# Altium project EQ_Guit.PrjPcb
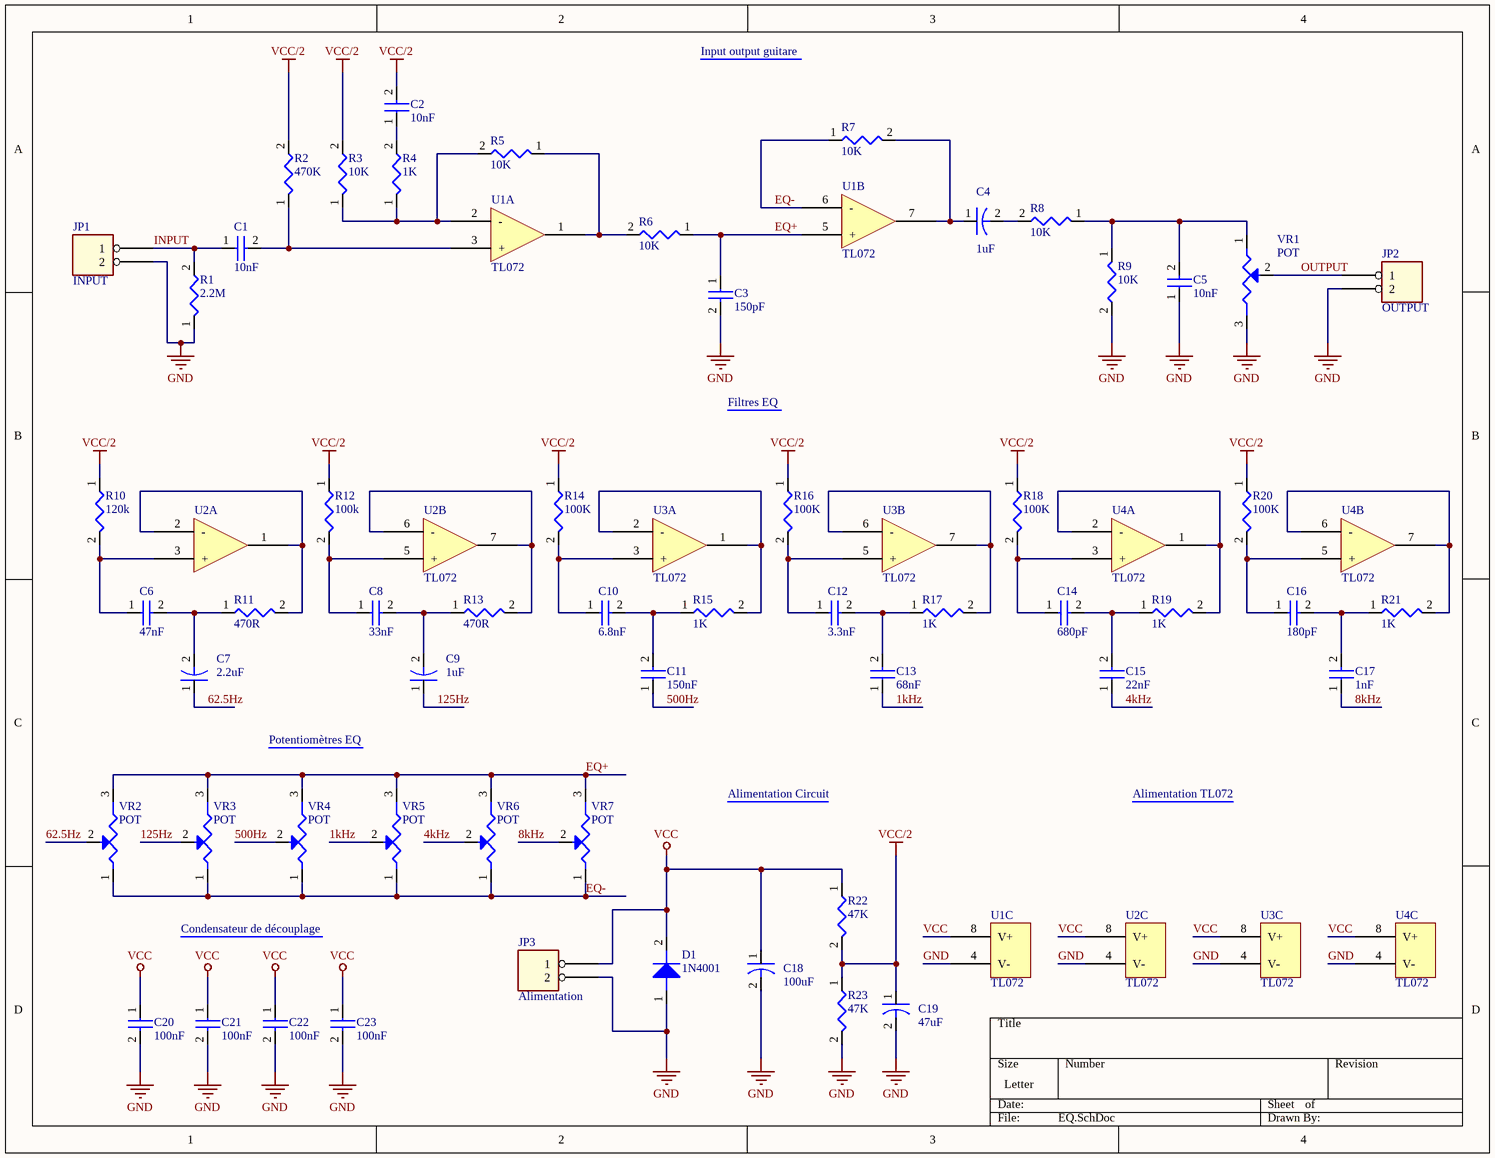
[diagram p0: EQ.SchDoc]
1 sheet, 61 parts. Net scope: global (net labels, ports and power ports of the same name join across sheets).
Board file: EQ.PcbDoc

## Sheet EQ.SchDoc: Pedale EQ
size Letter; DrawnBy: Alexandre DIonne; Revision: V1; SheetNumber: 1; SheetTotal: 1

### Parts
C1  10nF  [CAP_FILM]
C2  10nF  [CAP_FILM]
C3  150pF  [CAP_0603]
C4  1uF  [CAP_TH]
C5  10nF  [CAP_FILM]
C6  47nF  [CAP_FILM]
C7  2.2uF  [CAP_TH]
C8  33nF  [CAP_FILM]
C9  1uF  [CAP_TH]
C10  6.8nF  [CAP_FILM]
C11  150nF  [CAP_FILM]
C12  3.3nF  [CAP_FILM]
C13  68nF  [CAP_FILM]
C14  680pF  [CAP_0603]
C15  22nF  [CAP_FILM]
C16  180pF  [CAP_0603]
C17  1nF  [CAP_0603]
C18  100uF  [CAP_100uF]
C19  47uF  [CAP_TH]
C20  100nF  [CAP_0603]
C21  100nF  [CAP_0603]
C22  100nF  [CAP_0603]
C23  100nF  [CAP_0603]
D1  1N4001  [1N4001]
JP1  INPUT  [Header_2]
JP2  OUTPUT  [Header_2]
JP3  Alimentation  [Header_2]
R1  2.2M  [RES_0805]
R2  470K  [RES_0805]
R3  10K  [RES_0805]
R4  1K  [RES_0805]
R5  10K  [RES_0805]
R6  10K  [RES_0805]
R7  10K  [RES_0805]
R8  10K  [RES_0805]
R9  10K  [RES_0805]
R10  120k  [RES_0805]
R11  470R  [RES_0805]
R12  100k  [RES_0805]
R13  470R  [RES_0805]
R14  100K  [RES_0805]
R15  1K  [RES_0805]
R16  100K  [RES_0805]
R17  1K  [RES_0805]
R18  100K  [RES_0805]
R19  1K  [RES_0805]
R20  100K  [RES_0805]
R21  1K  [RES_0805]
R22  47K  [RES_0805]
R23  47K  [RES_0805]
U1  TL072  [TL072]  (parts A,B,C of 3)
U2  (no value)  [TL072]  (parts A,B,C of 3)
U3  TL072  [TL072]  (parts A,B,C of 3)
U4  TL072  [TL072]  (parts A,B,C of 3)
VR1  POT  [PT01-D120D-B503]
VR2  POT  [PT01-D120D-B503]
VR3  POT  [PT01-D120D-B503]
VR4  POT  [PT01-D120D-B503]
VR5  POT  [PT01-D120D-B503]
VR6  POT  [PT01-D120D-B503]
VR7  POT  [PT01-D120D-B503]

### Nets
GND: C3.2 C5.1 C18.2 C19.2 C20.2 C21.2 C22.2 C23.2 D1.1(ANODE) JP1.2 JP2.2 JP3.2 R1.1 R9.2 R23.2 U1.4(V-) U2.4(V-) U3.4(V-) U4.4(V-) VR1.3(B)
VCC: C18.1 C20.1 C21.1 C22.1 C23.1 D1.2(CATHODE) JP3.1 R22.1 U1.8(V+) U2.8(V+) U3.8(V+) U4.8(V+)
VCC/2: C2.2 C19.1 R2.2 R3.2 R10.1 R12.1 R14.1 R16.1 R18.1 R20.1 R22.2 R23.1
1kHz: C13.1 VR5.2(WIPER)
4kHz: C15.1 VR6.2(WIPER)
8kHz: C17.1 VR7.2(WIPER)
62.5Hz: C7.1 VR2.2(WIPER)
125Hz: C9.1 VR3.2(WIPER)
500Hz: C11.1 VR4.2(WIPER)
EQ+: C3.1 R6.1 U1.5(+) VR2.3(B) VR3.3(B) VR4.3(B) VR5.3(B) VR6.3(B) VR7.3(B)
EQ-: R7.1 U1.6(-) VR2.1(A) VR3.1(A) VR4.1(A) VR5.1(A) VR6.1(A) VR7.1(A)
INPUT: C1.1 JP1.1 R1.2
OUTPUT: JP2.1 VR1.2(WIPER)
NetC1_2: C1.2 R2.1 U1.3(+)
NetC2_1: C2.1 R4.2
NetC4_1: C4.1 R7.2 U1.7
NetC4_2: C4.2 R8.2
NetC5_2: C5.2 R8.1 R9.1 VR1.1(A)
NetC6_1: C6.1 R10.2 U2.3(+)
NetC6_2: C6.2 C7.2 R11.1
NetC8_1: C8.1 R12.2 U2.5(+)
NetC8_2: C8.2 C9.2 R13.1
NetC10_1: C10.1 R14.2 U3.3(+)
NetC10_2: C10.2 C11.2 R15.1
NetC12_1: C12.1 R16.2 U3.5(+)
NetC12_2: C12.2 C13.2 R17.1
NetC14_1: C14.1 R18.2 U4.3(+)
NetC14_2: C14.2 C15.2 R19.1
NetC16_1: C16.1 R20.2 U4.5(+)
NetC16_2: C16.2 C17.2 R21.1
NetR3_1: R3.1 R4.1 R5.2 U1.2(-)
NetR5_1: R5.1 R6.2 U1.1
NetR11_2: R11.2 U2.1 U2.2(-)
NetR13_2: R13.2 U2.6(-) U2.7
NetR15_2: R15.2 U3.1 U3.2(-)
NetR17_2: R17.2 U3.6(-) U3.7
NetR19_2: R19.2 U4.1 U4.2(-)
NetR21_2: R21.2 U4.6(-) U4.7

### Notes on the sheet
- Input output guitare
- Filtres EQ
- Potentiomètres EQ
- Alimentation Circuit
- Alimentation TL072
- Condensateur de découplage

### Library data of the parts
C1-C3 C5 C6 C8 C10-C17 C20-C23 = CAP NP
C4 C7 C9 C18 C19 = CAP
D1 = DIODE
JP1-JP3 = HEADER 2
R1-R23 = R
U2 = TL072